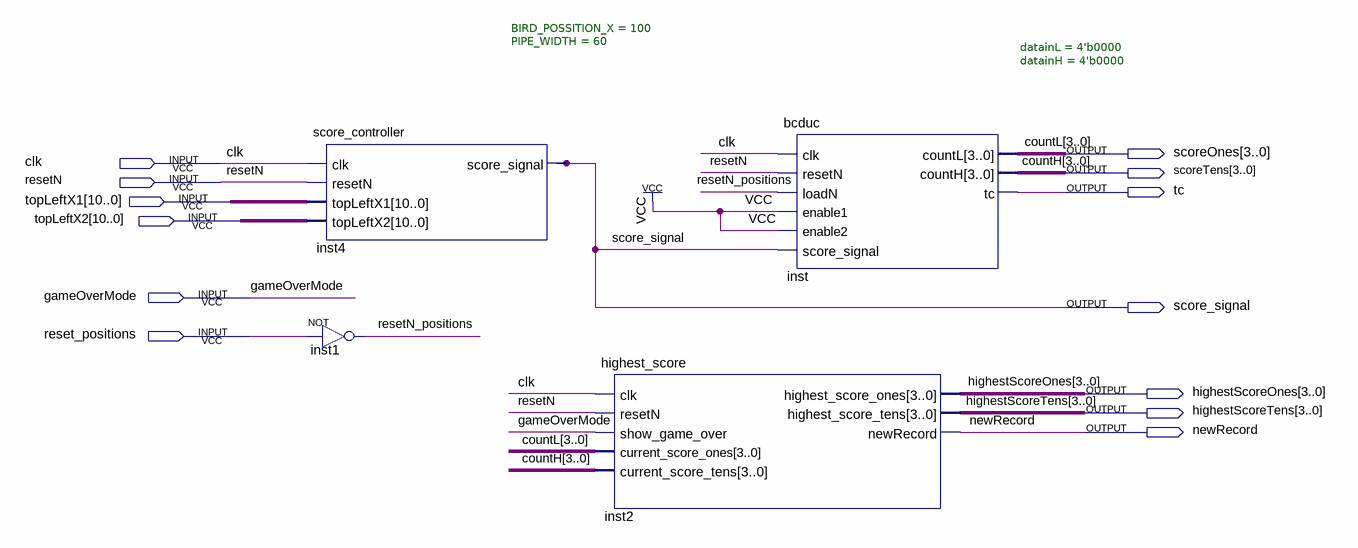
[diagram p0: schematic sheet]
// Quartus schematic SCORE_CONTROLLER_UNIT.bdf as structural Verilog: 4 symbols, 13 pins
module SCORE_CONTROLLER_UNIT (
  input  clk,
  input  resetN,
  input  [10:0] topLeftX1,
  input  [10:0] topLeftX2,
  input  gameOverMode,
  input  reset_positions,
  output [3:0] scoreOnes,
  output [3:0] scoreTens,
  output tc,
  output score_signal,
  output [3:0] highestScoreOnes,
  output [3:0] highestScoreTens,
  output newRecord
);

  wire resetN_positions;

  score_controller #(.BIRD_POSSITION_X(100), .PIPE_WIDTH(60)) inst4 (
    .clk(clk), .resetN(resetN), .topLeftX1(topLeftX1), .topLeftX2(topLeftX2), .score_signal(score_signal));
  not inst1 (resetN_positions, reset_positions);
  highest_score inst2 (
    .clk(clk), .resetN(resetN), .show_game_over(gameOverMode), .current_score_ones(scoreOnes),
    .current_score_tens(scoreTens), .highest_score_ones(highestScoreOnes),
    .highest_score_tens(highestScoreTens), .newRecord(newRecord));
  bcduc #(.datainL(4'b0000), .datainH(4'b0000)) inst (
    .clk(clk), .resetN(resetN), .loadN(resetN_positions), .enable1(1'b1), .enable2(1'b1),
    .score_signal(score_signal), .countL(scoreOnes), .countH(scoreTens), .tc(tc));

  // Other names for the same wires on the sheet: countH[3:0] = scoreTens; countL[3:0] = scoreOnes
endmodule
